# Altium schematic sheet 05_KOM_ACB23_4009_MicroController.SchDoc: MicroController
size A4; DocumentNumber: 2023-03-28; Revision: v0.11; SheetNumber: 5; SheetTotal: 9
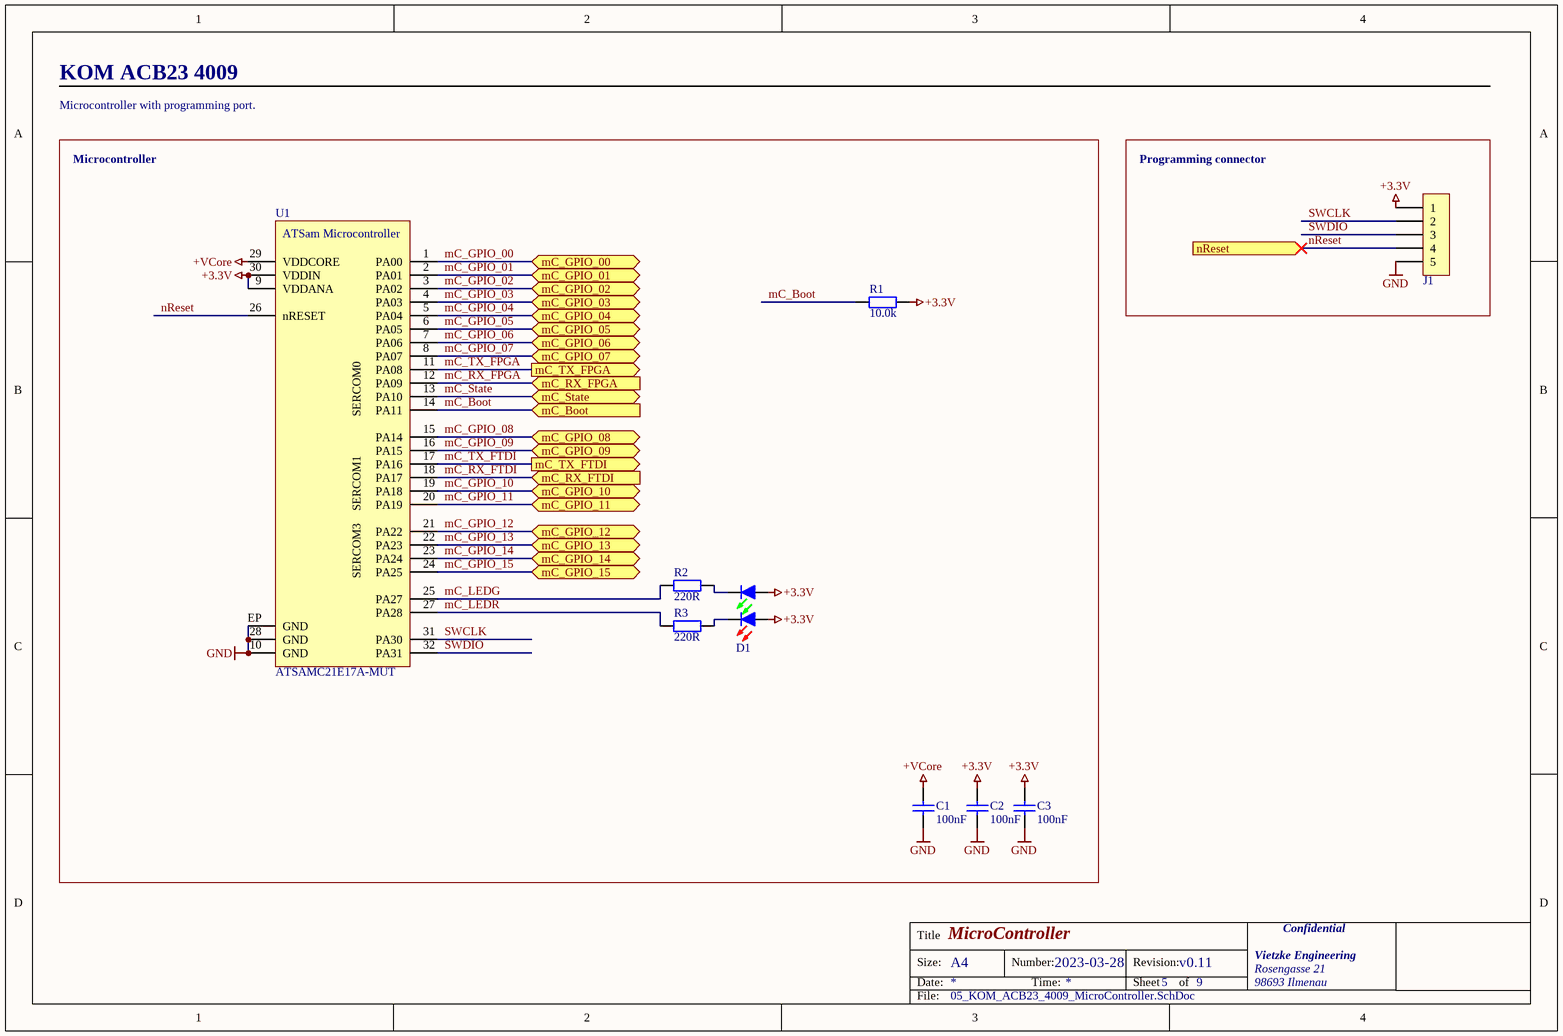
[diagram p0: 05_KOM_ACB23_4009_MicroController.SchDoc]

## Parts
C1  value 100nF  [C0402]  (hidden comment: C0402C104K3RACTU)
C2  value 100nF  [C0402]  (hidden comment: C0402C104K3RACTU)
C3  value 100nF  [C0402]  (hidden comment: C0402C104K3RACTU)
D1  LTST-C195KGJRKT  [SMD LED 0606 DUAL GREEN RED]  (value not drawn)
J1  53047-0510  [PicoBlade 01x05 THT Male]  (value not drawn)
R1  value 10.0k  [R0402]  (hidden comment: RC0402FR-0710KL)
R2  value 220R  [R0402]  (hidden comment: RC0402FR-07220RL)
R3  value 220R  [R0402]  (hidden comment: RC0402FR-07220RL)
U1  ATSAMC21E17A-MUT  [QFN32_5x5_0.50]

## Blocks framed on the sheet
Microcontroller: C1-C3 D1 R1-R3 U1
Programming connector: J1

## Ports
mC_Boot (in), mC_GPIO_00 (bidir), mC_GPIO_01 (bidir), mC_GPIO_02 (bidir), mC_GPIO_03 (bidir), mC_GPIO_04 (bidir), mC_GPIO_05 (bidir), mC_GPIO_06 (bidir), mC_GPIO_07 (bidir), mC_GPIO_08 (bidir), mC_GPIO_09 (bidir), mC_GPIO_10 (bidir), mC_GPIO_11 (bidir), mC_GPIO_12 (bidir), mC_GPIO_13 (bidir), mC_GPIO_14 (bidir), mC_GPIO_15 (bidir), mC_RX_FPGA (in), mC_RX_FTDI (in), mC_State (bidir), mC_TX_FPGA (out), mC_TX_FTDI (out), nReset (in)

## Nets
+3.3V: C2.2 C3.2 D1.1(AG) D1.2(AR) J1.1 R1.2 U1.9(VDDANA) U1.30(VDDIN)
+VCore: C1.2 U1.29(VDDCORE)
GND: C1.1 C2.1 C3.1 J1.5 U1.10(GND) U1.28(GND) U1.EP(GND)
mC_Boot: R1.1 U1.14(PA11) ; port mC_Boot
mC_GPIO_00: U1.1(PA00) ; port mC_GPIO_00
mC_GPIO_01: U1.2(PA01) ; port mC_GPIO_01
mC_GPIO_02: U1.3(PA02) ; port mC_GPIO_02
mC_GPIO_03: U1.4(PA03) ; port mC_GPIO_03
mC_GPIO_04: U1.5(PA04) ; port mC_GPIO_04
mC_GPIO_05: U1.6(PA05) ; port mC_GPIO_05
mC_GPIO_06: U1.7(PA06) ; port mC_GPIO_06
mC_GPIO_07: U1.8(PA07) ; port mC_GPIO_07
mC_GPIO_08: U1.15(PA14) ; port mC_GPIO_08
mC_GPIO_09: U1.16(PA15) ; port mC_GPIO_09
mC_GPIO_10: U1.19(PA18) ; port mC_GPIO_10
mC_GPIO_11: U1.20(PA19) ; port mC_GPIO_11
mC_GPIO_12: U1.21(PA22) ; port mC_GPIO_12
mC_GPIO_13: U1.22(PA23) ; port mC_GPIO_13
mC_GPIO_14: U1.23(PA24) ; port mC_GPIO_14
mC_GPIO_15: U1.24(PA25) ; port mC_GPIO_15
mC_LEDG: R2.1 U1.25(PA27)
mC_LEDR: R3.1 U1.27(PA28)
mC_RX_FPGA: U1.12(PA09) ; port mC_RX_FPGA
mC_RX_FTDI: U1.18(PA17) ; port mC_RX_FTDI
mC_State: U1.13(PA10) ; port mC_State
mC_TX_FPGA: U1.11(PA08) ; port mC_TX_FPGA
mC_TX_FTDI: U1.17(PA16) ; port mC_TX_FTDI
nReset: J1.4 U1.26(nRESET) ; port nReset
SWCLK: J1.2 U1.31(PA30)
SWDIO: J1.3 U1.32(PA31)
NetD1_3: D1.3(KG) R2.2
NetD1_4: D1.4(KR) R3.2

## Notes on the sheet
- KOM ACB23 4009
- Microcontroller with programming port.
- Title
- Size:
- Date:
- A4
- Number:
- Time:
- Revision:
- Sheet
- of
- Vietzke Engineering
- Rosengasse 21
- 98693 Ilmenau
- Confidential
- File:
- (in symbol ATSAMC21E17A-MUT) ATSam Microcontroller; SERCOM0; SERCOM1; SERCOM3

## Library data of the parts
C1-C3 = C0402C104K3RACTU: 0402 100nF 25.0V; Type: SMD; Package: 0402; Supplier 1: Mouser; Supplier Part Number 1: 80-C0402C104K3R
D1 = LTST-C195KGJRKT: SMD LED 0606 Dual RED GREEN; Type: SMD; Package: 0603; Supplier 1: Mouser; Supplier Part Number 1: 859-LTST-C195KGJRKT
J1 = 53047-0510: PicoBlade 01x05 Male THT; Type: THT; Package: -; Supplier 1: Mouser; Supplier Part Number 1: 538-53047-0510
R1 = RC0402FR-0710KL: 0402 10.0K; Type: SMD; Package: 0402; Supplier 1: Mouser; Supplier Part Number 1: 603-RC0402FR-0710KL
R2 R3 = RC0402FR-07220RL: 0402 220R; Type: SMD; Package: 0402; Supplier 1: Mouser; Supplier Part Number 1: 603-RC0402FR-07220RL
U1 = ATSAMC21E17A-MUT: 32-Bit ATSam ARM 128KB Flash; Type: SMD; Package: QFN32; Supplier 1: Mouser; Supplier Part Number 1: 556-ATSAMC21E17A-MUT